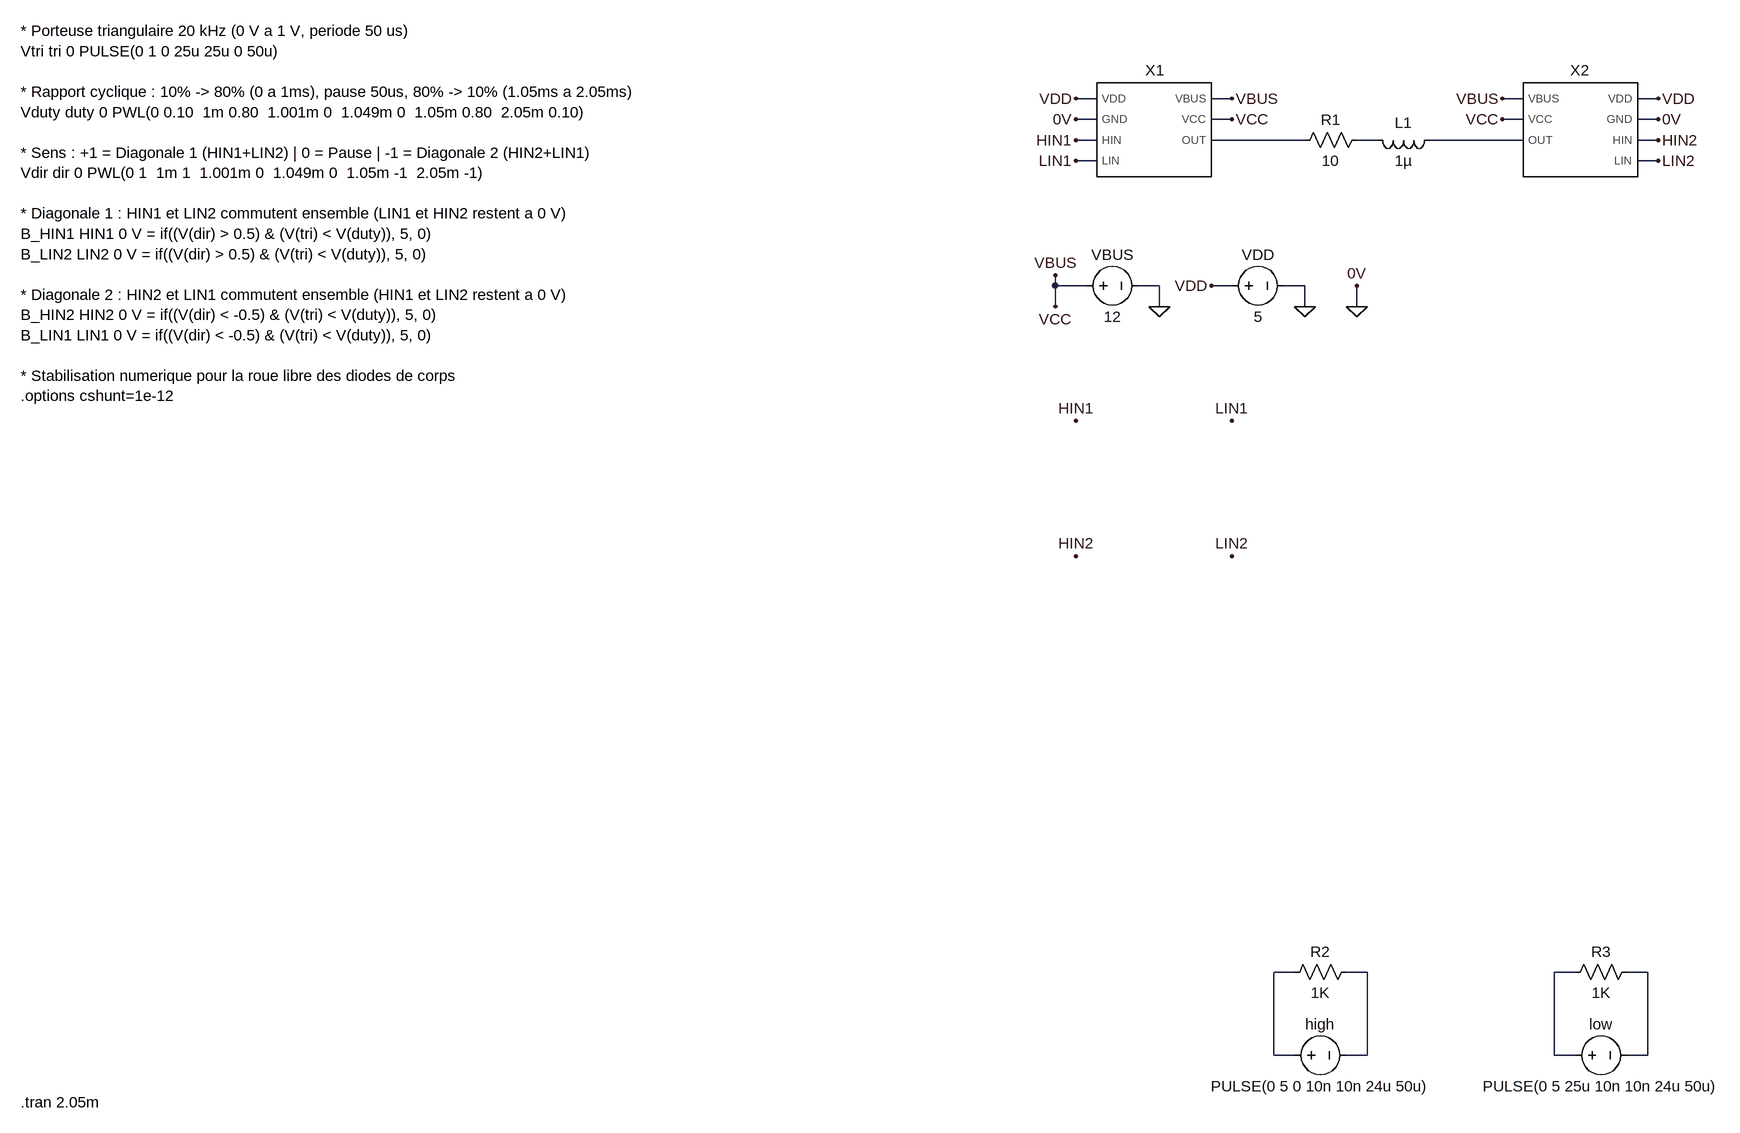
[diagram p0: schematic full-bridge.asc]
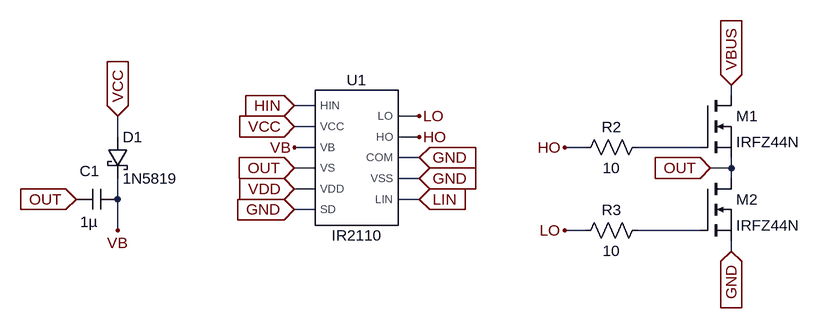
[diagram p1: sub-circuit half-bridge.asc]
full-bridge.asc, the LTspice schematic file:
Version 4.1
SHEET 1 1516 1608
WIRE -64 48 -96 48
WIRE 144 48 112 48
WIRE 592 48 560 48
WIRE 800 48 768 48
WIRE -64 80 -96 80
WIRE 144 80 112 80
WIRE 592 80 560 80
WIRE 800 80 768 80
WIRE -64 112 -96 112
WIRE 256 112 112 112
WIRE 368 112 336 112
WIRE 592 112 448 112
WIRE 800 112 768 112
WIRE -64 144 -96 144
WIRE 800 144 768 144
WIRE -128 336 -128 320
WIRE -80 336 -128 336
WIRE 32 336 0 336
WIRE 144 336 112 336
WIRE 256 336 224 336
WIRE -128 368 -128 336
WIRE 32 368 32 336
WIRE 256 368 256 336
WIRE 336 368 336 336
WIRE 240 1392 208 1392
WIRE 352 1392 320 1392
WIRE 672 1392 640 1392
WIRE 784 1392 752 1392
WIRE 208 1520 208 1392
WIRE 240 1520 208 1520
WIRE 352 1520 352 1392
WIRE 352 1520 320 1520
WIRE 640 1520 640 1392
WIRE 672 1520 640 1520
WIRE 784 1520 784 1392
WIRE 784 1520 752 1520
FLAG 144 80 VCC
FLAG 144 48 VBUS
FLAG -96 80 0V
FLAG -96 48 VDD
FLAG -96 112 HIN1
FLAG -96 144 LIN1
FLAG 560 80 VCC
FLAG 560 48 VBUS
FLAG 800 80 0V
FLAG 800 48 VDD
FLAG 800 112 HIN2
FLAG 800 144 LIN2
FLAG 32 368 0
FLAG -128 320 VBUS
FLAG 256 368 0
FLAG 112 336 VDD
FLAG -128 368 VCC
FLAG 336 368 0
FLAG 336 336 0V
FLAG -96 544 HIN1
FLAG 144 544 LIN1
FLAG -96 752 HIN2
FLAG 144 752 LIN2
SYMBOL half-bridge 32 112 R0
SYMATTR InstName X1
SYMBOL res 352 96 R90
WINDOW 0 0 56 VBottom 2
WINDOW 3 32 56 VTop 2
SYMATTR InstName R1
SYMATTR Value 10
SYMBOL ind 464 96 R90
WINDOW 0 5 56 VBottom 2
WINDOW 3 32 56 VTop 2
SYMATTR InstName L1
SYMATTR Value 1µ
SYMATTR SpiceLine Rser=1m
SYMBOL half-bridge 672 112 M0
SYMATTR InstName X2
SYMBOL voltage -96 336 R270
WINDOW 0 32 56 VTop 2
WINDOW 3 -32 56 VBottom 2
WINDOW 123 0 0 Left 0
WINDOW 39 0 0 Left 0
SYMATTR InstName VBUS
SYMATTR Value 12
SYMBOL voltage 128 336 R270
WINDOW 0 32 56 VTop 2
WINDOW 3 -32 56 VBottom 2
WINDOW 123 0 0 Left 0
WINDOW 39 0 0 Left 0
SYMATTR InstName VDD
SYMATTR Value 5
SYMBOL voltage 224 1520 R270
WINDOW 0 32 56 VTop 2
WINDOW 3 -32 56 VBottom 2
WINDOW 123 0 0 Left 0
WINDOW 39 0 0 Left 0
SYMATTR InstName high
SYMATTR Value PULSE(0 5 0 10n 10n 24u 50u)
SYMBOL res 336 1376 R90
WINDOW 0 0 56 VBottom 2
WINDOW 3 32 56 VTop 2
SYMATTR InstName R2
SYMATTR Value 1K
SYMBOL voltage 656 1520 R270
WINDOW 0 32 56 VTop 2
WINDOW 3 -32 56 VBottom 2
WINDOW 123 0 0 Left 0
WINDOW 39 0 0 Left 0
SYMATTR InstName low
SYMATTR Value PULSE(0 5 25u 10n 10n 24u 50u)
SYMBOL res 768 1376 R90
WINDOW 0 0 56 VBottom 2
WINDOW 3 32 56 VTop 2
SYMATTR InstName R3
SYMATTR Value 1K
TEXT -1720 -56 Left 2 !* Porteuse triangulaire 20 kHz (0 V a 1 V, periode 50 us)\nVtri tri 0 PULSE(0 1 0 25u 25u 0 50u)\n \n* Rapport cyclique : 10% -> 80% (0 a 1ms), pause 50us, 80% -> 10% (1.05ms a 2.05ms)\nVduty duty 0 PWL(0 0.10  1m 0.80  1.001m 0  1.049m 0  1.05m 0.80  2.05m 0.10)\n \n* Sens : +1 = Diagonale 1 (HIN1+LIN2) | 0 = Pause | -1 = Diagonale 2 (HIN2+LIN1)\nVdir dir 0 PWL(0 1  1m 1  1.001m 0  1.049m 0  1.05m -1  2.05m -1)\n \n* Diagonale 1 : HIN1 et LIN2 commutent ensemble (LIN1 et HIN2 restent a 0 V)\nB_HIN1 HIN1 0 V = if((V(dir) > 0.5) & (V(tri) < V(duty)), 5, 0)\nB_LIN2 LIN2 0 V = if((V(dir) > 0.5) & (V(tri) < V(duty)), 5, 0)\n \n* Diagonale 2 : HIN2 et LIN1 commutent ensemble (HIN1 et LIN2 restent a 0 V)\nB_HIN2 HIN2 0 V = if((V(dir) < -0.5) & (V(tri) < V(duty)), 5, 0)\nB_LIN1 LIN1 0 V = if((V(dir) < -0.5) & (V(tri) < V(duty)), 5, 0)\n \n* Stabilisation numerique pour la roue libre des diodes de corps\n.options cshunt=1e-12
TEXT -1720 1592 Left 2 !.tran 2.05m

half-bridge.asc, the sub-circuit schematic file:
Version 4.1
SHEET 1 1748 680
WIRE 1392 -560 1392 -576
WIRE 752 -544 720 -544
WIRE 912 -528 880 -528
WIRE 752 -512 720 -512
WIRE 448 -496 448 -528
WIRE 912 -496 880 -496
WIRE 752 -480 720 -480
WIRE 1168 -480 1136 -480
WIRE 1344 -480 1248 -480
WIRE 912 -464 880 -464
WIRE 752 -448 720 -448
WIRE 1392 -448 1392 -464
WIRE 1392 -448 1360 -448
WIRE 912 -432 880 -432
WIRE 1392 -432 1392 -448
WIRE 752 -416 720 -416
WIRE 448 -400 448 -432
WIRE 912 -400 880 -400
WIRE 752 -384 720 -384
WIRE 448 -352 448 -400
WIRE 1168 -352 1136 -352
WIRE 1344 -352 1248 -352
WIRE 1392 -320 1392 -336
FLAG 720 -512 VCC
IOPIN 720 -512 In
FLAG 912 -496 HO
FLAG 912 -528 LO
FLAG 720 -544 HIN
IOPIN 720 -544 In
FLAG 912 -400 LIN
IOPIN 912 -400 In
FLAG 1392 -320 GND
IOPIN 1392 -320 In
FLAG 1392 -576 VBUS
IOPIN 1392 -576 In
FLAG 1136 -352 LO
FLAG 1136 -480 HO
FLAG 720 -416 VDD
IOPIN 720 -416 In
FLAG 1360 -448 OUT
IOPIN 1360 -448 In
FLAG 720 -448 OUT
IOPIN 720 -448 In
FLAG 720 -480 VB
FLAG 448 -528 VCC
IOPIN 448 -528 In
FLAG 448 -352 VB
FLAG 384 -400 OUT
IOPIN 384 -400 In
FLAG 720 -384 GND
IOPIN 720 -384 In
FLAG 912 -464 GND
IOPIN 912 -464 In
FLAG 912 -432 GND
IOPIN 912 -432 In
SYMBOL IR2110 816 -464 M0
SYMATTR InstName U1
SYMBOL nmos 1344 -560 R0
SYMATTR InstName M1
SYMATTR Value IRFZ44N
SYMBOL nmos 1344 -432 R0
SYMATTR InstName M2
SYMATTR Value IRFZ44N
SYMBOL res 1264 -496 R90
WINDOW 0 0 56 VBottom 2
WINDOW 3 32 56 VTop 2
SYMATTR InstName R2
SYMATTR Value 10
SYMBOL res 1264 -368 R90
WINDOW 0 0 56 VBottom 2
WINDOW 3 32 56 VTop 2
SYMATTR InstName R3
SYMATTR Value 10
SYMBOL schottky 432 -496 R0
SYMATTR InstName D1
SYMATTR Value 1N5819
SYMATTR Description Diode
SYMATTR Type diode
SYMBOL cap 448 -416 R90
WINDOW 0 -12 43 VBottom 2
WINDOW 3 35 44 VTop 2
SYMATTR InstName C1
SYMATTR Value 1µ

The netlist it stands for:
* full-bridge.asc
X§X1 0 HIN1 LIN1 N001 VBUS VBUS VDD half-bridge
R1 N002 N001 10
L1 N003 N002 1µ Rser=1m
X§X2 0 HIN2 LIN2 N003 VBUS VBUS VDD half-bridge
VBUS VBUS 0 12
VDD VDD 0 5
V§high N004 N005 PULSE(0 5 0 10n 10n 24u 50u)
R2 N005 N004 1K
V§low N006 N007 PULSE(0 5 25u 10n 10n 24u 50u)
R3 N007 N006 1K

* block symbol definitions
.subckt half-bridge GND HIN LIN OUT VBUS VCC VDD
X§U1 LO HO GND GND LIN HIN VCC VB OUT VDD GND IR2110  ; pins LO HO COM VSS LIN HIN VCC VB VS VDD SD
M1 VBUS N001 OUT OUT IRFZ44N
M2 OUT N002 GND GND IRFZ44N
R2 N001 HO 10
R3 N002 LO 10
D1 VCC VB 1N5819
C1 VB OUT 1µ
.ends half-bridge

.model D D
.lib standard.dio
.model NMOS NMOS
.model PMOS PMOS
.lib standard.mos
* Porteuse triangulaire 20 kHz (0 V a 1 V, periode 50 us)
Vtri tri 0 PULSE(0 1 0 25u 25u 0 50u)
* Rapport cyclique : 10% -> 80% (0 a 1ms), pause 50us, 80% -> 10% (1.05ms a 2.05ms)
Vduty duty 0 PWL(0 0.10  1m 0.80  1.001m 0  1.049m 0  1.05m 0.80  2.05m 0.10)
* Sens : +1 = Diagonale 1 (HIN1+LIN2) | 0 = Pause | -1 = Diagonale 2 (HIN2+LIN1)
Vdir dir 0 PWL(0 1  1m 1  1.001m 0  1.049m 0  1.05m -1  2.05m -1)
* Diagonale 1 : HIN1 et LIN2 commutent ensemble (LIN1 et HIN2 restent a 0 V)
B_HIN1 HIN1 0 V = if((V(dir) > 0.5) & (V(tri) < V(duty)), 5, 0)
B_LIN2 LIN2 0 V = if((V(dir) > 0.5) & (V(tri) < V(duty)), 5, 0)
* Diagonale 2 : HIN2 et LIN1 commutent ensemble (HIN1 et LIN2 restent a 0 V)
B_HIN2 HIN2 0 V = if((V(dir) < -0.5) & (V(tri) < V(duty)), 5, 0)
B_LIN1 LIN1 0 V = if((V(dir) < -0.5) & (V(tri) < V(duty)), 5, 0)
* Stabilisation numerique pour la roue libre des diodes de corps
.options cshunt=1e-12
.tran 2.05m
.lib IR2110.lib
.backanno
.end